# Altium project LgSafety-HWv1.0.PrjPcb (part 3 of 3)

## Sheet LINEAR _ACTUATOR_RIGHT_SHEET.SchDoc
size A4; SheetNumber: 8; SheetTotal: 10
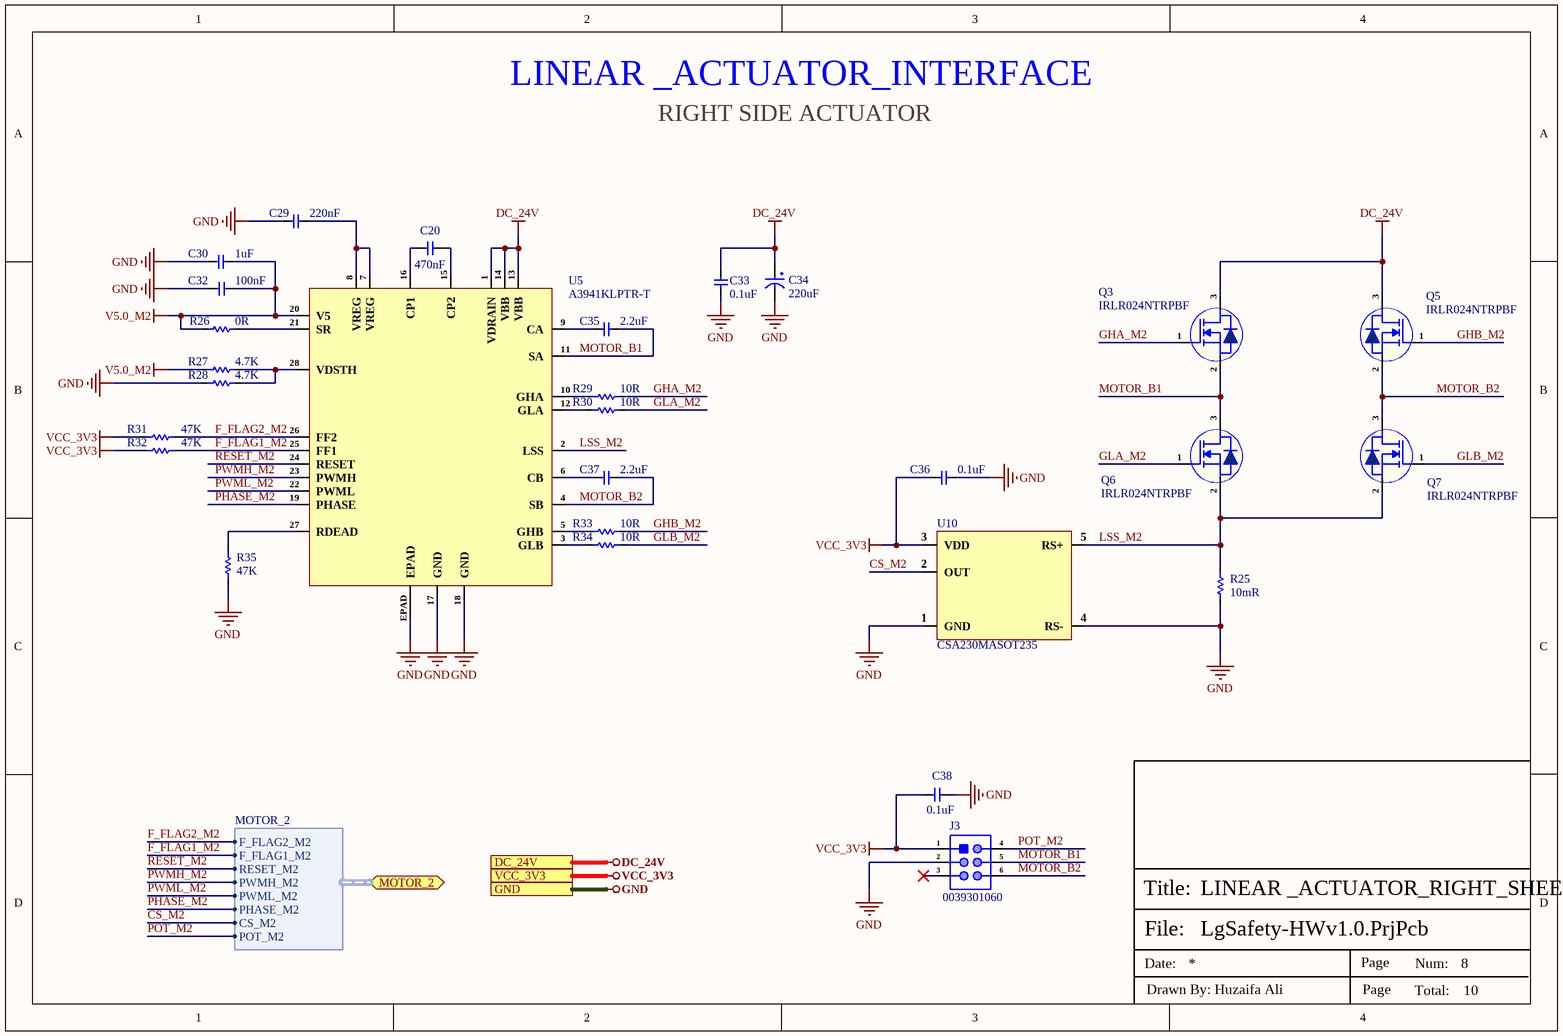
[diagram p6: LINEAR _ACTUATOR_RIGHT_SHEET.SchDoc]

### Parts
C20  470nF  [Cap-1206]
C29  220nF  [Cap-1206]
C30  1uF  [Cap-0402]
C32  100nF  [cap-0402]
C33  0.1uF  [Cap-1206]
C34  220uF  [UCD-220uF-10mmDia]
C35  2.2uF  [Cap-0805]
C36  0.1uF  [Cap-1206]
C37  2.2uF  [Cap-0805]
C38  0.1uF  [Cap-1206]
J3  0039301060  [0039301060]
Q3  IRLR024NTRPBF  [DPAK]
Q5  IRLR024NTRPBF  [DPAK]
Q6  IRLR024NTRPBF  [DPAK]
Q7  IRLR024NTRPBF  [DPAK]
R25  10mR  [RES-2512]
R26  0R  [Res-0402]
R27  4.7K  [Res-0603]
R28  4.7K  [Res-0603]
R29  10R  [RES-0805]
R30  10R  [RES-0805]
R31  47K  [Res-0603]
R32  47K  [Res-0603]
R33  10R  [RES-0805]
R34  10R  [RES-0805]
R35  47K  [Res-0402]
U5  A3941KLPTR-T  [28-TSSOP-EP]
U10  CSA230MASOT235  [SOT-23-5]

### Ports
DC_24V (see LINEAR _ACTUATOR_LEFT_SHEET[2D], POWER_SHEET[3D]), GND (see CONTROLLER_SHEET[3C], IR BEAM_BREAK_SENSOR_SHEET[3D], LINEAR _ACTUATOR_LEFT_SHEET[2D], POWER_SHEET[3D], PRESENCE_SENSOR_SHEET[3D]), MOTOR_2 (bidir, harness MOTOR_2, see CONTROLLER_SHEET[2D]), VCC_3V3 (see CONTROLLER_SHEET[3C], IR BEAM_BREAK_SENSOR_SHEET[3D], LINEAR _ACTUATOR_LEFT_SHEET[2D], POWER_SHEET[3D], PRESENCE_SENSOR_SHEET[3D])

### Harnesses
MOTOR_2: F_FLAG2_M2, F_FLAG1_M2, RESET_M2, PWMH_M2, PWML_M2, PHASE_M2, CS_M2, POT_M2

### Nets
DC_24V: C33.2 C34.1 Q3.3(D) Q5.3(D) U5.1(VDRAIN) U5.13(VBB) U5.14(VBB) ; port DC_24V
GND: C29.2 C30.1 C32.2 C33.1 C34.2 C36.1 C38.1 J3.2 R25.1 R28.1 R35.1 U5.17(GND) U5.18(GND) U5.EPAD U10.1(GND) U10.4(RS-) ; port GND
V5.0_M2: C30.2 C32.1 R26.1 R27.1 U5.20(V5)
VCC_3V3: C36.2 C38.2 J3.1 R31.2 R32.2 U10.3(VDD) ; port VCC_3V3
CS_M2: U10.2(OUT) ; port MOTOR_2.CS_M2
F_FLAG1_M2: R32.1 U5.25(FF1) ; port MOTOR_2.F_FLAG1_M2
F_FLAG2_M2: R31.1 U5.26(FF2) ; port MOTOR_2.F_FLAG2_M2
GHA_M2: Q3.1(G) R29.2
GHB_M2: Q5.1(G) R33.2
GLA_M2: Q6.1(G) R30.2
GLB_M2: Q7.1(G) R34.2
LSS_M2: Q6.2(S) Q7.2(S) R25.2 U5.2(LSS) U10.5(RS+)
MOTOR_B1: C35.1 J3.5 Q3.2(S) Q6.3(D) U5.11(SA)
MOTOR_B2: C37.1 J3.6 Q5.2(S) Q7.3(D) U5.4(SB)
PHASE_M2: U5.19(PHASE) ; port MOTOR_2.PHASE_M2
POT_M2: J3.4 ; port MOTOR_2.POT_M2
PWMH_M2: U5.23(PWMH) ; port MOTOR_2.PWMH_M2
PWML_M2: U5.22(PWML) ; port MOTOR_2.PWML_M2
RESET_M2: U5.24(RESET) ; port MOTOR_2.RESET_M2
NetC20_1: C20.1 U5.16(CP1)
NetC20_2: C20.2 U5.15(CP2)
NetC29_1: C29.1 U5.7(VREG) U5.8(VREG)
NetC35_2: C35.2 U5.9(CA)
NetC37_2: C37.2 U5.6(CB)
NetR26_2: R26.2 U5.21(SR)
NetR27_2: R27.2 R28.2 U5.28(VDSTH)
NetR29_1: R29.1 U5.10(GHA)
NetR30_1: R30.1 U5.12(GLA)
NetR33_1: R33.1 U5.5(GHB)
NetR34_1: R34.1 U5.3(GLB)
NetR35_2: R35.2 U5.27(RDEAD)

Not connected (* = marked no-connect by the designer): J3 3*

### Notes on the sheet
- RIGHT SIDE ACTUATOR
- LINEAR _ACTUATOR_INTERFACE
- File:
- Title:
- Date:
- Page
- Num:
- Total:
- Drawn By: Huzaifa Ali

### Library data of the parts
C20 = CC1206KKX7R0BB474: CAP CER 0.47UF 100V X7R 1206; Manufacturer: Yageo; Item Type: Capacitor; Supplier: Digikey; LCSC Part Number: C107182; Manufacturer Part Number: CC1206KKX7R0BB474; RoHS: Yes; Stock: 5000; Pricing: 1=0.32, 10=0.209, 50=0.1538, 100=0.1252, 500=0.0988, 1000=0.08344 (USD); ComponentLink1URL: https://datasheet.ciiva.com/13208/upy-gp-np0-16v-to-50v-8-13208711.pdf?src-supplier=Mouser; ComponentLink1Description: https://datasheet.ciiva.com/13208/upy-gp-np0-16v-to-50v-8-13208711.pdf?src-supplier=Mouser
C29 = CC1206JKX7R9BB224: CAP CER 0.22UF 50V X7R 1206; Manufacturer: Yageo; Item Type: Capacitor; Supplier: Future Electronics; Supplier Part Number: 4639209; Manufacturer Part Number: CC1206JKX7R9BB224; RoHS: Yes; Category: Ceramic Capacitors; Stock: 3000; Pricing: 3000=0.0381, 9000=0.0366, 15000=0.036, 30000=0.0351, 60000=0.0337 (USD); ComponentLink1URL: https://datasheet.ciiva.com/13210/upy-gp-np0-16v-to-50v-8-13210060.pdf?src-supplier=Mouser; ComponentLink1Description: https://datasheet.ciiva.com/13210/upy-gp-np0-16v-to-50v-8-13210060.pdf?src-supplier=Mouser; ComponentLink2URL: https://datasheet.ciiva.com/11466/upy-gphc-x7r-6-3v-to-50v-8-11466351.pdf?src-supplier=Avnet; ComponentLink2Description: https://datasheet.ciiva.com/11466/upy-gphc-x7r-6-3v-to-50v-8-11466351.pdf?src-supplier=Avnet; LCSC Part Number: C527274
C30 = GRM155R61E105KA12D: CAP CER 1UF 25V X5R 0402; Manufacturer: Murata; Material: Ceramic; Tolerance: 10%; Supplier 1: Digi-Key; Manufacturer Part Number: GRM155R61E105KA12D; Stock 1: 1150750; Pricing 1: 1=0.11, 10=0.077, 100=0.0363, 500=0.02546, 1000=0.02108, 2500=0.01962, 5000=0.01795 (USD); Mount: Surface Mount; Case/Package: 0402; Weight: 0.000212oz; Case Code (Metric): 1005; Case Code (Imperial): 0402; Min Operating Temperature: -55°C; Max Operating Temperature: 85°C; Capacitance: 1uF; Voltage Rating: 25V; Packaging: Tape and Reel; Dielectric: X5R; Voltage: 25V; Termination: SMD/SMT; Voltage Rating (DC): 25V; Package Quantity: 10000; Length: 1mm; Height: 0.5mm; Width: 0.5mm; Thickness: 0.022inch; Depth: 0.5mm; REACH SVHC: No SVHC; Lead Free: Lead Free; ComponentLink1URL: http://www.farnell.com/datasheets/2048341.pdf?src-supplier=Element14; ComponentLink1Description: http://www.farnell.com/datasheets/2048341.pdf?src-supplier=Element14; Supplier Part Number 1: 490-10017-6-ND; LCSC Part Number: C77009
C32 = C1005X7R1H104KT000F: CAP CER 0.1UF 50V X7R 0402; Manufacturer: TDK; Tolerance: 10%; Voltage: 25V; Item Type: Capacitor; Supplier 1: Avnet; Manufacturer Part Number: C1005X7R1H104KT000F; RoHS: No; Category: Ceramic Capacitors; Dielectric: X7R; Supplier Part Number 1: C1005X7R1H104KT000F; LCSC Part Number: C361198; ComponentLink1Description: LCSC; ComponentLink1URL: https://www.lcsc.com/product-detail/Multilayer-Ceramic-Capacitors-MLCC-SMD-SMT_TDK-C1005X7R1H104KT000F_C361198.html
C33 C36 C38 = CC1206KKX7R0BB104: CAP CER 0.1UF 100V X7R 1206; Manufacturer: Yageo; Dielectric Material: Ceramic; Tolerance: 10%; Voltage: 63V; Capacitance: 100nF; Item Type: Capacitor; Supplier 1: Avnet; Manufacturer Part Number: CC1206KKX7R0BB104; RoHS: Yes; Category: Ceramic Capacitors; Stock 1: 24000; Pricing 1: 3000=0.01588, 6000=0.01565, 12000=0.01520, 18000=0.01486, 24000=0.01429, 30000=0.01395, 300000=0.01361 (USD); Mount: Surface Mount; Case/Package: 1206; Number of Pins: 2; Case Code (Metric): 3216; Case Code (Imperial): 1206; Min Operating Temperature: -55°C; Max Operating Temperature: 125°C; Dielectric: X7R; Package Quantity: 1; Voltage Rating: 100V; Packaging: Tape and Reel; Voltage Rating (DC): 100V; Termination: SMD/SMT; Resistor Type: Ceramic; Series: CC; Length: 3.2mm; Width: 0.063inch; Height: 1.25mm; Thickness: 0.057inch; Depth: 1.6mm; Radiation Hardening: No; RoHS Compliant: Yes; Reach SVHC Compliant: Yes; Lead Free: Lead Free; ComponentLink1URL: https://datasheet.ciiva.com/7978/1447671-7978227.pdf?src-supplier=Element14; ComponentLink1Description: https://datasheet.ciiva.com/7978/1447671-7978227.pdf?src-supplier=Element14; ComponentLink2URL: https://datasheet.ciiva.com/46391/1919308-46391993.pdf?src-supplier=Element14; ComponentLink2Description: https://datasheet.ciiva.com/46391/1919308-46391993.pdf?src-supplier=Element14; ComponentLink3URL: https://datasheet.ciiva.com/180/mlccorderingcode-180145.pdf?src-supplier=Digi-Key; ComponentLink3Description: https://datasheet.ciiva.com/180/mlccorderingcode-180145.pdf?src-supplier=Digi-Key; ComponentLink4URL: https://datasheet.ciiva.com/180/mlccorderingcode-180144.pdf?src-supplier=Digi-Key; ComponentLink4Description: https://datasheet.ciiva.com/180/mlccorderingcode-180144.pdf?src-supplier=Digi-Key; ComponentLink5URL: https://datasheet.ciiva.com/180/mlccorderingcode-180146.pdf?src-supplier=Digi-Key; ComponentLink5Description: https://datasheet.ciiva.com/180/mlccorderingcode-180146.pdf?src-supplier=Digi-Key; ComponentLink6URL: https://datasheet.ciiva.com/5425/upy-gp-np0-16v-to-50v-8-5425573.pdf?src-supplier=Mouser; ComponentLink6Description: https://datasheet.ciiva.com/5425/upy-gp-np0-16v-to-50v-8-5425573.pdf?src-supplier=Mouser; ComponentLink7URL: https://datasheet.ciiva.com/16981/upy-np0x7r-mv-100-to-630v-9-16981180.pdf?src-supplier=Future+Electronics; ComponentLink7Description: https://datasheet.ciiva.com/16981/upy-np0x7r-mv-100-to-630v-9-16981180.pdf?src-supplier=Future+Electronics; ComponentLink8URL: https://datasheet.ciiva.com/26829/getdatasheetpartid-403790-26829655.pdf?src-supplier=Verical; ComponentLink8Description: https://datasheet.ciiva.com/26829/getdatasheetpartid-403790-26829655.pdf?src-supplier=Verical; Supplier Part Number 1: CC1206KKX7R0BB104; LCSC Part Number: C107181
C34 = UCD1H221MNL1GS: CAP ALUM 220UF 20% 50V SMD; Manufacturer: Nichicon; Ripple Current: 700mA; Impedance: 160mR; Leakage Current: 3uA; Life (Hours): 5000Hour; Dissipation Factor: 0.1%; Item Type: Capacitor; Supplier 1: Digi-Key; Manufacturer Part Number: UCD1H221MNL1GS; RoHS: Yes; Category: Aluminum Electrolytic Capacitors; Pricing 1: 1=0.85000, 10=0.60200, 50=0.45480, 100=0.39620 (USD); Mount: Surface Mount,PCB; Case/Package: Radial; Min Operating Temperature: -55°C; Max Operating Temperature: 105°C; Capacitance: 220uF; Tolerance: 20%; Voltage Rating: 50V; Packaging: Tape and Reel; Package Quantity: 1; Voltage Rating (DC): 50V; Termination: SMD/SMT; Voltage: 50V; Features: General Purpose; Series: CD; Construction: Cylindrical; Diameter: 10mm; Length: 10mm; Height: 10mm; Height - Seated (Max): 0.394inch; Radiation Hardening: No; Lead Free: Lead Free; RoHS Compliant: Yes; ComponentLink1URL: https://datasheet.ciiva.com/11776/0900766b80ebdadd-11776792.pdf?src-supplier=RSComponents; ComponentLink1Description: https://datasheet.ciiva.com/11776/0900766b80ebdadd-11776792.pdf?src-supplier=RSComponents; ComponentLink2URL: https://datasheet.ciiva.com/5362/e-cd-22158-5362489.pdf?src-supplier=Mouser; ComponentLink2Description: https://datasheet.ciiva.com/5362/e-cd-22158-5362489.pdf?src-supplier=Mouser; ComponentLink3URL: https://datasheet.ciiva.com/11684/e-cd-11684678.pdf?src-supplier=Avnet; ComponentLink3Description: https://datasheet.ciiva.com/11684/e-cd-11684678.pdf?src-supplier=Avnet; ComponentLink4URL: https://datasheet.ciiva.com/15037/e-cd-15037119.pdf?src-supplier=Digi-Key; ComponentLink4Description: https://datasheet.ciiva.com/15037/e-cd-15037119.pdf?src-supplier=Digi-Key; ComponentLink5URL: https://datasheet.ciiva.com/16393/e-cd-16393493.pdf?src-supplier=Future+Electronics; ComponentLink5Description: https://datasheet.ciiva.com/16393/e-cd-16393493.pdf?src-supplier=Future+Electronics; ComponentLink6URL: https://datasheet.ciiva.com/17354/e-cd-17354606.pdf?src-supplier=Avnet+Europe; ComponentLink6Description: https://datasheet.ciiva.com/17354/e-cd-17354606.pdf?src-supplier=Avnet+Europe; Supplier Part Number 1: 493-6390-1-ND; LCSC Part Number: C116211
C35 C37 = CC0805KKX5R9BB225: CAP CER 2.2UF 50V X5R 0805; Manufacturer: Yageo; Tolerance: 10%; Item Type: Capacitor; Supplier 1: Mouser; Manufacturer Part Number: CC0805KKX5R9BB225; RoHS: Yes; Category: Ceramic Capacitors; Stock 1: 3880; Pricing 1: 1=0.26000, 10=0.12100, 50=0.12100, 100=0.08700, 1000=0.06700, 10000=0.05000 (USD); Mounting Technology: Surface Mount; Case/Package: 0805; Case Code (Metric): 2012; Case Code (Imperial): 0805; Weight: 0.000194oz; Min Operating Temperature: -55°C; Max Operating Temperature: 85°C; Packaging: Tape and Reel; Value: 2.2uF; Voltage Rating: 50V; Dielectric: X5R; Termination: SMD/SMT; Resistor Type: Ceramic; Voltage Rating (DC): 50V; Package Quantity: 3000; Length: 0.079inch; Width: 1.25mm; Thickness: 0.057inch; Lead Free: Lead Free; Halogen Free: Halogen Free; RoHS Compliant: Yes; ComponentLink1URL: http://www.mouser.com/ds/2/447/Yageo_UPY-GP_NP0_16V-to-50V_9-358835.pdf?src-supplier=Mouser; ComponentLink1Description: http://www.mouser.com/ds/2/447/Yageo_UPY-GP_NP0_16V-to-50V_9-358835.pdf?src-supplier=Mouser; ComponentLink2URL: http://www.yageo.com/documents/recent/UPY-GPHC_X5R_4V-to-50V_25.pdf?src-supplier=Digi-Key; ComponentLink2Description: http://www.yageo.com/documents/recent/UPY-GPHC_X5R_4V-to-50V_25.pdf?src-supplier=Digi-Key; Supplier Part Number 1: 603-CC805KKX5R9BB225; LCSC Part Number: C326581
J3 = 0039301060: CONN HEADER R/A 6POS 4.2MM; Manufacturer: Molex; Item Type: Headers, Male Pins; Supplier: Mouser; Supplier Part Number: 538-39-30-1060; Manufacturer Part Number: 0039301060; RoHS: Yes; Stock: 9943; Pricing: 1=1.12, 10=0.953, 50=0.953, 100=0.856, 1000=0.7, 10000=0.545 (USD)
Q3 Q5-Q7 = IRLR024NTRPBF: MOSFET N-CH 55V 17A DPAK; Manufacturer: Infineon; Item Type: MOSFETs; Nominal Vgs: 2V; Number of Elements: 1NUMBER; Rise Time: 74ns; Fall Time: 29ns; Element Configuration: 5460ElementConfiguration; On-State Resistance: 65mR; Value: 80mR; Supplier: Arrow Electronics; LCSC Part Number: C3007; Manufacturer Part Number: IRLR024NTRPBF; RoHS: Yes; Stock: 96000; Pricing: 2000=0.2743, 4000=0.2526, 10000=0.25, 24000=0.2048 (USD); Current Rating: 17A; Voltage Rating (DC): 55V; Package Quantity: 2000NUMBER; Number of Channels: 1NUMBER; Radiation Hardening: 5898YesNo
R25 = PA2512FKE7T0R01E: RES 0.01 OHM 1% 3W 2512; Manufacturer: Yageo; Item Type: Resistor; Supplier: Avnet; LCSC Part Number: C375691; Manufacturer Part Number: PA2512FKE7T0R01E; RoHS: No; Stock: 4000; Pricing: 1=0.926, 25=0.703, 50=0.63, 100=0.557, 250=0.485 (USD)
R26 = RCS04020000Z0ED: RES SMD 0 OHM JUMPER 1/5W 0402; Manufacturer: Vishay Dale; Resistance: 0mR; Max Power Dissipation: 200mW; Item Type: Resistor; Supplier 1: Digi-Key; Manufacturer Part Number: RCS04020000Z0ED; Stock 1: 35470; Pricing 1: 1=0.1, 10=0.083, 25=0.0576, 50=0.0448, 100=0.032, 250=0.02496, 500=0.01984, 1000=0.01408, 5000=0.01088 (USD); Case/Package: 0402; Case Code (Metric): 1005; Case Code (Imperial): 0402; Min Operating Temperature: -55°C; Max Operating Temperature: 155°C; Packaging: Tape and Reel; Resistor Type: Thick Film; Number of Terminations: 2; Features: Automotive AEC-Q200; Length: 0.039inch; Width: 0.02inch; Height: 0.016inch; RoHS Compliant: Yes; ComponentLink1URL: http://www.farnell.com/datasheets/2618474.pdf?src-supplier=Farnell; ComponentLink1Description: http://www.farnell.com/datasheets/2618474.pdf?src-supplier=Farnell; ComponentLink2URL: http://www.farnell.com/datasheets/2618474.pdf?src-supplier=Element14; ComponentLink2Description: http://www.farnell.com/datasheets/2618474.pdf?src-supplier=Element14; ComponentLink3URL: http://www.vishay.com/docs/20065/rcse3.pdf?src-supplier=Digi-Key; ComponentLink3Description: http://www.vishay.com/docs/20065/rcse3.pdf?src-supplier=Digi-Key; ComponentLink4URL: http://www.farnell.com/datasheets/2618474.pdf?src-supplier=Newark; ComponentLink4Description: http://www.farnell.com/datasheets/2618474.pdf?src-supplier=Newark; Supplier Part Number 1: 541-2877-1-ND; LCSC Part Number: C844673
R27 R28 = RC0603FR-074K7L: RES SMD 4.7K OHM 1% 1/10W 0603; Manufacturer: Yageo; Item Type: Resistor; Manufacturer Part Number: RC0603FR-074K7L; Package: 0603; ComponentLink7Description: LCSC; ComponentLink7URL: https://www.lcsc.com/product-detail/Chip-Resistor-Surface-Mount_YAGEO-RC0603FR-074K7L_C99782.html; LCSC Part Number: C99782
R29 R30 R33 R34 = CRCW080510R0FKEAHP: RES SMD 10 OHM 1% 1/2W 0805; Manufacturer: Vishay; Item Type: Resistor; Power Rating: 330mW; Voltage Rating: 150V; Temperature Coefficient: 100ppm/°C; Max Power Dissipation: 333mW; Supplier: Mouser; LCSC Part Number: C844598; Manufacturer Part Number: CRCW080510R0FKEAHP; RoHS: Yes; Stock: 384044; Pricing: 1=0.19, 10=0.066, 50=0.066, 100=0.04, 1000=0.027, 10000=0.023 (USD); Case/Package: 0805; Weight: 0.000194oz; Case Code (Imperial): 0805; Case Code (Metric): 2012; Contact Plating: Tin; Min Operating Temperature: -55°C; Max Operating Temperature: 155°C; Value: 10R; Tolerance: 1%; Packaging: Tape and Reel; Package Quantity: 5000; Resistor Type: Thick Film; Termination: SMD/SMT; Voltage Rating (DC): 150V; Features: Automotive AEC-Q200; Series: CRCW-HP; Number of Terminations: 2; Resistance Tolerance: 1%; Technology: THICK FILM; Construction: Rectangular; Length: 2mm; Width: 1.2mm; Height: 0.5mm; Depth: 1.25mm; Ratings: AEC-Q200; Radiation Hardening: No; Military Standard: Not; Lead Free: Lead Free; RoHS Compliant: Yes; Reach SVHC Compliant: Unknown; ComponentLink1URL: http://www.farnell.com/datasheets/2884039.pdf?src-supplier=Newark; ComponentLink1Description: http://www.farnell.com/datasheets/2884039.pdf?src-supplier=Newark; ComponentLink2URL: https://datasheet.octopart.com/CRCW080510R0FKEAHP-Vishay-datasheet-87136057.pdf?src-supplier=Newark; ComponentLink2Description: https://datasheet.octopart.com/CRCW080510R0FKEAHP-Vishay-datasheet-87136057.pdf?src-supplier=Newark; ComponentLink3URL: http://www.vishay.com/docs/20043/crcwhpe3.pdf?src-supplier=Digikey; ComponentLink3Description: http://www.vishay.com/docs/20043/crcwhpe3.pdf?src-supplier=Digikey
R31 R32 = RC0603JR-0747KL: RES 47K OHM 5% 1/10W 0603; Manufacturer: Yageo; Resistance: 47kR; Power Rating: 100mW; Voltage Rating (DC): 50V; Temperature Coefficient: 100ppm/°C; Resistance Tolerance: 1%; Supplier 1: Arrow; Manufacturer Part Number: RC0603JR-0747KL; Stock 1: 599135; Pricing 1: 5000=0.0025, 10000=0.0022, 25000=0.0019, 1=0.0011, 6000=0.001 (USD); Case/Package: 0603; Number of Pins: 2; Case Code (Imperial): 0603; Case Code (Metric): 1608; Min Operating Temperature: -55°C; Max Operating Temperature: 155°C; Packaging: Tape and Reel; Tolerance: 5%; Voltage Rating: 50V; Package Quantity: 5000; Termination: SMD/SMT; Military Standard: Not; Composition: Thick Film; Length: 1.6mm; Height: 0.45mm; Width: 0.8mm; Depth: 0.8mm; REACH SVHC: No SVHC; Lead Free: Lead Free; ComponentLink1URL: http://www.farnell.com/datasheets/443971.pdf; ComponentLink1Description: http://www.farnell.com/datasheets/443971.pdf; ComponentLink2URL: http://www.mouser.com/catalog/specsheets/RC0603.pdf; ComponentLink2Description: http://www.mouser.com/catalog/specsheets/RC0603.pdf; Supplier Part Number 1: RC0603JR-0747KL; Supplier 2: Digi-Key; RoHS: Yes; Category: Chip SMD Resistors; Stock 2: 1087850; Pricing 2: 1=0.10000, 10=0.02300, 100=0.00930, 1000=0.00417, 2500=0.00362 (USD); Size Code: 0603; Number of Terminations: 2; Resistor Type: Thick Film; Features: Moisture Resistant; Series: RC; Max Power Dissipation: 100mW; Construction: Rectangular; RoHS Compliant: Yes; ComponentLink3URL: https://datasheet.ciiva.com/46395/443971-46395003.pdf?src-supplier=Element14; ComponentLink3Description: https://datasheet.ciiva.com/46395/443971-46395003.pdf?src-supplier=Element14; ComponentLink4URL: https://datasheet.ciiva.com/12558/rc0603-272842-12558744.pdf?src-supplier=Mouser; ComponentLink4Description: https://datasheet.ciiva.com/12558/rc0603-272842-12558744.pdf?src-supplier=Mouser; Supplier Part Number 2: 311-30.0KHRCT-ND; LCSC Part Number: C127447
R35 = RCS040247K0FKED: RES SMD 47K OHM 1% 1/5W 0402; Manufacturer: Vishay Dale; Resistance: 47kR; Max Power Dissipation: 200mW; Temperature Coefficient: 100ppm/°C; Supplier 1: Digi-Key; Manufacturer Part Number: RCS040247K0FKED; Stock 1: 5377; Pricing 1: 1=0.12, 10=0.105, 100=0.0402, 1000=0.01771, 2500=0.0153, 5000=0.01368 (USD); Case/Package: 0402; Case Code (Metric): 1005; Case Code (Imperial): 0402; Min Operating Temperature: -55°C; Max Operating Temperature: 155°C; Packaging: Tape and Reel; Resistor Type: Thick Film; Number of Terminations: 2; Tolerance: 1%; Features: Automotive AEC-Q200; Length: 0.039inch; Width: 0.02inch; Height: 0.016inch; RoHS Compliant: Yes; ComponentLink1URL: http://www.vishay.com/docs/20065/rcse3.pdf?src-supplier=Digi-Key; ComponentLink1Description: http://www.vishay.com/docs/20065/rcse3.pdf?src-supplier=Digi-Key; Supplier Part Number 1: 541-2897-1-ND
U5 = A3941KLPTR-T: IC MOTOR DRIVER 5.5V-50V 28TSSOP; Manufacturer: Allegro MicroSystems; Supplier: Digikey; Supplier Part Number: 620-1236-1-ND; Manufacturer Part Number: A3941KLPTR-T; RoHS: Yes; Item Type: IC; Stock: 24636; Pricing: 1=3.93, 10=3.534, 25=3.3404, 100=2.8952, 250=2.74668, 500=2.4646, 1000=2.07858 (USD); ComponentLink1URL: https://datasheet.ciiva.com/1949/a3941-datasheet-1949853.pdf?src-supplier=Digikey; ComponentLink1Description: https://datasheet.ciiva.com/1949/a3941-datasheet-1949853.pdf?src-supplier=Digikey; ComponentLink2URL: https://datasheet.ciiva.com/1949/a3941-datasheet-1949853.pdf?src-supplier=Avnet; ComponentLink2Description: https://datasheet.ciiva.com/1949/a3941-datasheet-1949853.pdf?src-supplier=Avnet; ComponentLink3URL: https://datasheet.ciiva.com/15110/getdatasheetpartid-292391-15110112.pdf?src-supplier=Verical; ComponentLink3Description: https://datasheet.ciiva.com/15110/getdatasheetpartid-292391-15110112.pdf?src-supplier=Verical; ComponentLink4URL: https://datasheet.ciiva.com/6807/1481248-6807185.pdf?src-supplier=Newark; ComponentLink4Description: https://datasheet.ciiva.com/6807/1481248-6807185.pdf?src-supplier=Newark
U10 = CSA230MASOT235: 0V~76V Single SOT23-5 Current Sense Amplifiers ROHS; Manufacturer: analogysemi; Item Type: IC; Manufacturer Part Number: CSA230MASOT235; Package: SOT23-5; LCSC Part Number: C5359404; ComponentLink1Description: LCSC; ComponentLink1URL: https://www.lcsc.com/product-detail/Current-Sense-Amplifiers_analogysemi-CSA230MASOT235_C5359404.html

## Sheet PRESENCE_SENSOR_SHEET.SchDoc
size A4; SheetNumber: 9; SheetTotal: 10
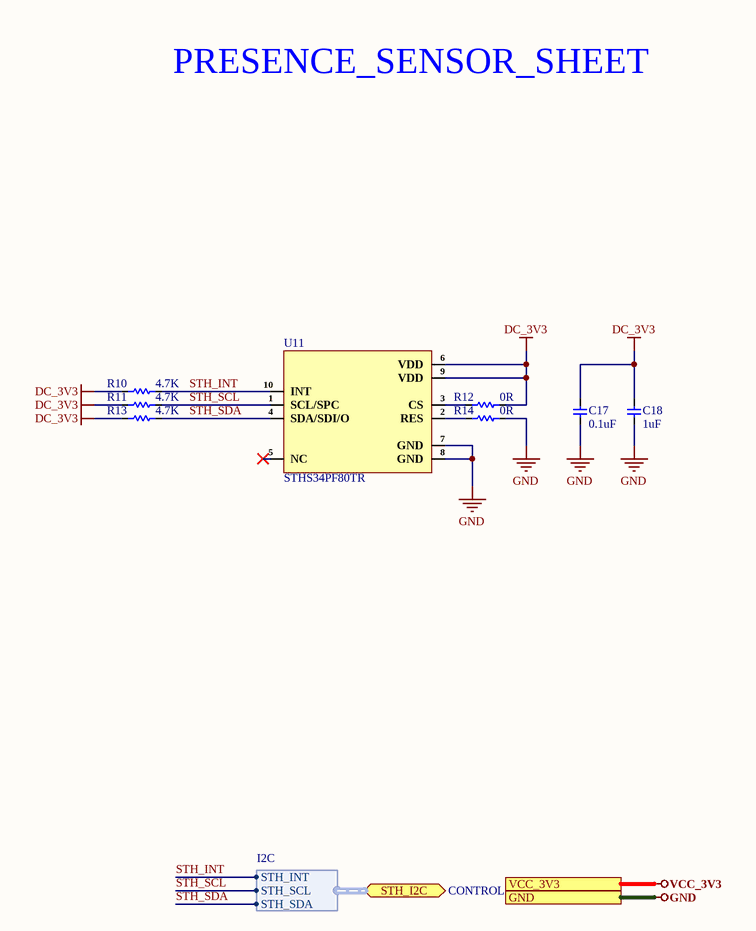
[diagram p7: PRESENCE_SENSOR_SHEET.SchDoc]

### Parts
C17  0.1uF  [Cap-0402]
C18  1uF  [Cap-0402]
R10  4.7K  [Res-0402]
R11  4.7K  [Res-0402]
R12  0R  [Res-0402]
R13  4.7K  [Res-0402]
R14  0R  [Res-0402]
U11  STHS34PF80TR  [10-OLGA (3.2x4.2)]

### Ports
GND (see CONTROLLER_SHEET[3C], IR BEAM_BREAK_SENSOR_SHEET[3D], LINEAR _ACTUATOR_LEFT_SHEET[2D], LINEAR _ACTUATOR_RIGHT_SHEET[2D], POWER_SHEET[3D]), STH_I2C (bidir, harness I2C, see CONTROLLER_SHEET[3D]), VCC_3V3 (see CONTROLLER_SHEET[3C], IR BEAM_BREAK_SENSOR_SHEET[3D], LINEAR _ACTUATOR_LEFT_SHEET[2D], LINEAR _ACTUATOR_RIGHT_SHEET[2D], POWER_SHEET[3D])

### Harnesses
I2C: STH_INT, STH_SCL, STH_SDA

### Nets
DC_3V3: C17.2 C18.2 R10.2 R11.2 R12.2 R13.2 U11.6(VDD) U11.9(VDD)
GND: C17.1 C18.1 R14.2 U11.7(GND) U11.8(GND) ; port GND
STH_INT: R10.1 U11.10(INT) ; port STH_I2C.STH_INT
STH_SCL: R11.1 U11.1(SCL/SPC) ; port STH_I2C.STH_SCL
STH_SDA: R13.1 U11.4(SDA/SDI/O) ; port STH_I2C.STH_SDA
NetR12_1: R12.1 U11.3(CS)
NetR14_1: R14.1 U11.2(RES)

Not connected (* = marked no-connect by the designer): U11 5(NC)*

### Notes on the sheet
- PRESENCE_SENSOR_SHEET
- File:
- Title:
- Date:
- Page
- Num:
- Total:
- Drawn By: Huzaifa Ali

### Library data of the parts
C17 = GRM155R71C104KA88D: CAP CER 0.1UF 16V X7R 0402; Manufacturer: Murata; Material: Ceramic; Value: 100nF; Tolerance: 10%; Insulation Resistance: 10GR; Item Type: Capacitor; Supplier 1: Arrow Electronics; Manufacturer Part Number: GRM155R71C104KA88D; RoHS: Yes; Category: Ceramic Capacitors; Stock 1: 1690322; Pricing 1: 10000=0.00480, 30000=0.00470, 100000=0.00350, 250000=0.00330 (USD); Mounting Technology: Surface Mount; Case/Package: 0402; Pins: 2; Case Code (Metric): 1005; Case Code (Imperial): 0402; Dielectric Material: Ceramic; Min Operating Temperature: -55°C; Max Operating Temperature: 125°C; Voltage Rating: 16V; Packaging: Tape and Reel; Voltage Rating (DC): 16V; Package Quantity: 1; Dielectric: X7R; Termination: SMD/SMT; Voltage: 16V; Series: GRM; Length: 1mm; Width: 0.02inch; Height: 0.5mm; Thickness: 0.022inch; Depth: 0.5mm; Radiation Hardening: No; Lead Free: Lead Free; RoHS Compliant: Yes; ComponentLink1URL: https://datasheet.ciiva.com/129/grm155r71c104ka88-01-129739.pdf?src-supplier=Digi-Key; ComponentLink1Description: https://datasheet.ciiva.com/129/grm155r71c104ka88-01-129739.pdf?src-supplier=Digi-Key; ComponentLink2URL: https://datasheet.ciiva.com/129/grm155r71c104ka88-01-129740.pdf?src-supplier=Digi-Key; ComponentLink2Description: https://datasheet.ciiva.com/129/grm155r71c104ka88-01-129740.pdf?src-supplier=Digi-Key; ComponentLink3URL: https://datasheet.ciiva.com/18102/getdatasheetpartid-85307-18102905.pdf?src-supplier=Verical; ComponentLink3Description: https://datasheet.ciiva.com/18102/getdatasheetpartid-85307-18102905.pdf?src-supplier=Verical; ComponentLink4URL: https://datasheet.ciiva.com/29199/454098-da-01-en-vs-kondensator-0402-29199799.pdf?src-supplier=Conrad; ComponentLink4Description: https://datasheet.ciiva.com/29199/454098-da-01-en-vs-kondensator-0402-29199799.pdf?src-supplier=Conrad; ComponentLink5URL: https://datasheet.ciiva.com/7937/4360-7937615.pdf?src-supplier=Element14; ComponentLink5Description: https://datasheet.ciiva.com/7937/4360-7937615.pdf?src-supplier=Element14; ComponentLink6URL: https://datasheet.ciiva.com/14116/grmseries-highdielectrictype-eng-14116878.pdf?src-supplier=Distrelec; ComponentLink6Description: https://datasheet.ciiva.com/14116/grmseries-highdielectrictype-eng-14116878.pdf?src-supplier=Distrelec; ComponentLink7URL: https://datasheet.ciiva.com/14103/grmseries-highdielectrictype-eng-14103750.pdf?src-supplier=Distrelec; ComponentLink7Description: https://datasheet.ciiva.com/14103/grmseries-highdielectrictype-eng-14103750.pdf?src-supplier=Distrelec; ComponentLink8URL: https://datasheet.ciiva.com/28534/4360-28534127.pdf?src-supplier=Element14; ComponentLink8Description: https://datasheet.ciiva.com/28534/4360-28534127.pdf?src-supplier=Element14; ComponentLink9URL: https://datasheet.ciiva.com/28534/4360-28534133.pdf?src-supplier=Element14; ComponentLink9Description: https://datasheet.ciiva.com/28534/4360-28534133.pdf?src-supplier=Element14; ComponentLink10URL: https://datasheet.ciiva.com/16199/product-16199000.pdf?src-supplier=Future+Electronics; ComponentLink10Description: https://datasheet.ciiva.com/16199/product-16199000.pdf?src-supplier=Future+Electronics; Supplier Part Number 1: GRM155R71C104KA88D; LCSC Part Number: C71629
C18 = GRM155R61E105KA12D: as C30 on sheet LINEAR _ACTUATOR_RIGHT_SHEET; Supplier 1: Digi-Key; Manufacturer Part Number: GRM155R61E105KA12D; Stock 1: 1150750; Pricing 1: 1=0.11, 10=0.077, 100=0.0363, 500=0.02546, 1000=0.02108, 2500=0.01962, 5000=0.01795 (USD); Mount: Surface Mount; Case/Package: 0402; Weight: 0.000212oz; Case Code (Metric): 1005; Case Code (Imperial): 0402; Min Operating Temperature: -55°C; Max Operating Temperature: 85°C; Capacitance: 1uF; Voltage Rating: 25V; Packaging: Tape and Reel; Dielectric: X5R; Voltage: 25V; Termination: SMD/SMT; Voltage Rating (DC): 25V; Package Quantity: 10000; Length: 1mm; Height: 0.5mm; Width: 0.5mm; Thickness: 0.022inch; Depth: 0.5mm; REACH SVHC: No SVHC; Lead Free: Lead Free; ComponentLink1URL: http://www.farnell.com/datasheets/2048341.pdf?src-supplier=Element14; ComponentLink1Description: http://www.farnell.com/datasheets/2048341.pdf?src-supplier=Element14; Supplier Part Number 1: 490-10017-6-ND; LCSC Part Number: C77009
R10 R11 R13 = RC0402FR-074K7L: RES 4.7K OHM 1% 1/16W 0402; Manufacturer: Yageo; Voltage Rating (DC): 50V; Power Rating: 62.5mW; Resistance: 4.7kR; Temperature Coefficient: 100ppm/°C; Max Power Dissipation: 63mW; Item Type: Resistor; Supplier 1: Avnet; Manufacturer Part Number: RC0402FR-074K7L; RoHS: Yes; Category: Chip SMD Resistors; Stock 1: 2420000; Pricing 1: 10000=0.00085 (USD); Case/Package: 0402; Number of Pins: 2; Case Code (Imperial): 0402; Case Code (Metric): 1005; Size Code: 0402; Min Operating Temperature: -55°C; Max Operating Temperature: 155°C; Tolerance: 1%; Voltage Rating: 50V; Packaging: Tape and Reel; Resistor Type: Thick Film; Termination: SMD/SMT; Features: Moisture Resistant; Series: RC; Number of Terminations: 2; Resistance Tolerance: 1%; Construction: Rectangular; Length: 1mm; Width: 0.5mm; Height: 0.32mm; Depth: 0.5mm; Height - Seated (Max): 0.016inch; RoHS Compliant: Yes; Reach SVHC Compliant: Yes; Military Standard: Not; Lead Free: Lead Free; ComponentLink1URL: https://datasheet.ciiva.com/22661/1686128-22661342.pdf?src-supplier=Element14; ComponentLink1Description: https://datasheet.ciiva.com/22661/1686128-22661342.pdf?src-supplier=Element14; ComponentLink2URL: https://datasheet.ciiva.com/7850/1018594-7850022.pdf?src-supplier=Element14; ComponentLink2Description: https://datasheet.ciiva.com/7850/1018594-7850022.pdf?src-supplier=Element14; ComponentLink3URL: https://datasheet.ciiva.com/7850/1018594-7850023.pdf?src-supplier=Element14; ComponentLink3Description: https://datasheet.ciiva.com/7850/1018594-7850023.pdf?src-supplier=Element14; ComponentLink4URL: https://datasheet.ciiva.com/15215/getdatasheetpartid-328119-15215035.pdf?src-supplier=Verical; ComponentLink4Description: https://datasheet.ciiva.com/15215/getdatasheetpartid-328119-15215035.pdf?src-supplier=Verical; Supplier Part Number 1: RC0402FR-074K7L; LCSC Part Number: C105871
R12 R14 = RC0402FR-070RL: RES 0 OHM JUMPER 1/16W 0402; Manufacturer: Yageo; Item Type: Resistors; Tolerance: 1%; Power Rating: 62.5mW; Voltage Rating: 50V; Temperature Coefficient: 200ppm/°C; Max Power Dissipation: 63mW; Supplier 1: Mouser; Manufacturer Part Number: RC0402FR-070RL; RoHS: Yes; Stock 1: 8556842; Pricing 1: 1=0.10000, 10=0.01400, 50=0.01400, 100=0.00600, 1000=0.00300, 5000=0.00200, 10000=0.00100 (USD); Mount: Surface Mount; Case/Package: 0402; Contact Plating: Tin,Matte; Case Code (Imperial): 0402; Case Code (Metric): 1005; Size Code: 0402; Min Operating Temperature: -55°C; Max Operating Temperature: 155°C; Resistance: 0R; Resistor Type: Thick Film; Packaging: Tape and Reel; Termination: SMD/SMT; Features: Moisture Resistant; Series: RC; Number of Terminations: 2; Length: 1mm; Width: 0.5mm; Height: 0.35mm; Radiation Hardening: No; Lead Free: Lead Free; RoHS Compliant: Yes; ComponentLink1URL: https://datasheet.ciiva.com/8896/pyu-rc0402-51-rohs-l-6-8896149.pdf?src-supplier=Avnet; ComponentLink1Description: https://datasheet.ciiva.com/8896/pyu-rc0402-51-rohs-l-6-8896149.pdf?src-supplier=Avnet; ComponentLink2URL: https://datasheet.ciiva.com/16790/pyu-rc0402-51-rohs-l-6-r-16790444.pdf?src-supplier=Future+Electronics; ComponentLink2Description: https://datasheet.ciiva.com/16790/pyu-rc0402-51-rohs-l-6-r-16790444.pdf?src-supplier=Future+Electronics; Supplier Part Number 1: 603-RC0402FR-070RL; LCSC Part Number: C106231
U11 = STHS34PF80TR: SENSOR OPT 5000-20000NM 10OLGA; Manufacturer: STMicroelectronics; Item Type: IC; Supplier: Arrow Electronics; Supplier Part Number: STHS34PF80TR; Manufacturer Part Number: STHS34PF80TR; RoHS: No; Stock: 49500; Pricing: 4500=3.223 (USD)

## Sheet STM ToF_SENSOR_SHEET.SchDoc
size A4; SheetNumber: 9; SheetTotal: 9

### Notes on the sheet
- File:
- Title:
- Date:
- Page
- Num:
- Total:
- Drawn By: Huzaifa Ali

## Nets that join several sheets
DC_24V: POWER_SHEET (12 pins), LINEAR _ACTUATOR_LEFT_SHEET (7 pins), LINEAR _ACTUATOR_RIGHT_SHEET (7 pins)
GND: POWER_SHEET (31 pins), CONTROLLER_SHEET (15 pins), GPIOs_INTERFACE_SHEET (7 pins), IR BEAM_BREAK_SENSOR_SHEET (5 pins), LINEAR _ACTUATOR_LEFT_SHEET (16 pins), LINEAR _ACTUATOR_RIGHT_SHEET (16 pins), PRESENCE_SENSOR_SHEET (5 pins)
VCC_3V3: POWER_SHEET (6 pins), CONTROLLER_SHEET (10 pins), GPIOs_INTERFACE_SHEET (6 pins), IR BEAM_BREAK_SENSOR_SHEET (R40.1), LINEAR _ACTUATOR_LEFT_SHEET (6 pins), LINEAR _ACTUATOR_RIGHT_SHEET (6 pins)
VCC_5V0: POWER_SHEET (9 pins), IR BEAM_BREAK_SENSOR_SHEET (5 pins)
CS_M1: CONTROLLER_SHEET (U3.11), LINEAR _ACTUATOR_LEFT_SHEET (U4.2)
CS_M2: CONTROLLER_SHEET (U3.12), LINEAR _ACTUATOR_RIGHT_SHEET (U10.2)
F_FLAG1_M1: CONTROLLER_SHEET (U3.40), LINEAR _ACTUATOR_LEFT_SHEET (R21.1 U9.25)
F_FLAG1_M2: CONTROLLER_SHEET (U3.20), LINEAR _ACTUATOR_RIGHT_SHEET (R32.1 U5.25)
F_FLAG2_M1: CONTROLLER_SHEET (U3.41), LINEAR _ACTUATOR_LEFT_SHEET (R20.1 U9.26)
F_FLAG2_M2: CONTROLLER_SHEET (U3.39), LINEAR _ACTUATOR_RIGHT_SHEET (R31.1 U5.26)
IR_BEAM: CONTROLLER_SHEET (U3.45), IR BEAM_BREAK_SENSOR_SHEET (R41.1)
IR_BEAM_OUT: CONTROLLER_SHEET (U3.46), IR BEAM_BREAK_SENSOR_SHEET (J5.3 R40.2)
PHASE_M1: CONTROLLER_SHEET (U3.42), LINEAR _ACTUATOR_LEFT_SHEET (U9.19)
PHASE_M2: CONTROLLER_SHEET (U3.43), LINEAR _ACTUATOR_RIGHT_SHEET (U5.19)
POT_M1: CONTROLLER_SHEET (U3.13), LINEAR _ACTUATOR_LEFT_SHEET (J2.4)
POT_M2: CONTROLLER_SHEET (U3.14), LINEAR _ACTUATOR_RIGHT_SHEET (J3.4)
PWMH_M1: CONTROLLER_SHEET (U3.16), LINEAR _ACTUATOR_LEFT_SHEET (U9.23)
PWMH_M2: CONTROLLER_SHEET (U3.18), LINEAR _ACTUATOR_RIGHT_SHEET (U5.23)
PWML_M1: CONTROLLER_SHEET (U3.17), LINEAR _ACTUATOR_LEFT_SHEET (U9.22)
PWML_M2: CONTROLLER_SHEET (U3.19), LINEAR _ACTUATOR_RIGHT_SHEET (U5.22)
RESET_M1: CONTROLLER_SHEET (U3.29), LINEAR _ACTUATOR_LEFT_SHEET (U9.24)
RESET_M2: CONTROLLER_SHEET (U3.30), LINEAR _ACTUATOR_RIGHT_SHEET (U5.24)
STH_INT: CONTROLLER_SHEET (U3.25), PRESENCE_SENSOR_SHEET (R10.1 U11.10)
STH_SCL: CONTROLLER_SHEET (U3.21), PRESENCE_SENSOR_SHEET (R11.1 U11.1)
STH_SDA: CONTROLLER_SHEET (U3.22), PRESENCE_SENSOR_SHEET (R13.1 U11.4)